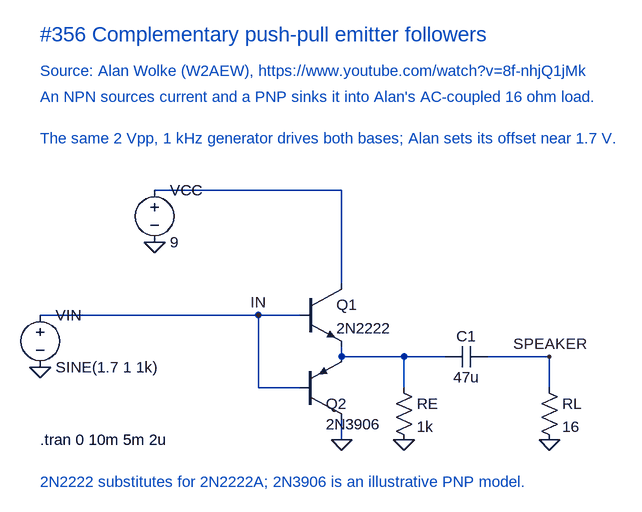
[diagram p0: schematic Complementary push-pull follower.asc]
Complementary push-pull follower.asc, the LTspice schematic file:
Version 4
SHEET 1 1312 800
WIRE 864 176 576 176
WIRE 864 320 864 176
WIRE 736 368 400 368
WIRE 800 368 736 368
WIRE 736 480 736 368
WIRE 800 480 736 480
WIRE 864 432 864 416
WIRE 1024 432 864 432
WIRE 960 480 960 432
WIRE 864 560 864 528
WIRE 1184 432 1088 432
WIRE 1184 480 1184 432
FLAG 576 256 0
FLAG 400 448 0
FLAG 864 560 0
FLAG 960 560 0
FLAG 1184 560 0
FLAG 736 368 IN
FLAG 1184 432 SPEAKER
SYMBOL voltage 576 160 R0
SYMATTR InstName VCC
SYMATTR Value 9
SYMBOL voltage 400 352 R0
SYMATTR InstName VIN
SYMATTR Value SINE(1.7 1 1k)
SYMBOL npn 800 320 R0
SYMATTR InstName Q1
SYMATTR Value 2N2222
SYMBOL pnp 800 528 M180
WINDOW 0 40 24 Left 2
WINDOW 3 40 -8 Left 2
SYMATTR InstName Q2
SYMATTR Value 2N3906
SYMBOL res 944 464 R0
SYMATTR InstName RE
SYMATTR Value 1k
SYMBOL cap 1088 416 R90
WINDOW 0 0 32 VBottom 2
WINDOW 3 32 32 VTop 2
SYMATTR InstName C1
SYMATTR Value 47u
SYMBOL res 1168 464 R0
SYMATTR InstName RL
SYMATTR Value 16
TEXT 400 -64 Left 3 ;#356 Complementary push-pull emitter followers
TEXT 400 -8 Left 2 ;Source: Alan Wolke (W2AEW), https://www.youtube.com/watch?v=8f-nhjQ1jMk
TEXT 400 32 Left 2 ;An NPN sources current and a PNP sinks it into Alan's AC-coupled 16 ohm load.
TEXT 400 96 Left 2 ;The same 2 Vpp, 1 kHz generator drives both bases; Alan sets its offset near 1.7 V.
TEXT 400 624 Left 2 ;2N2222 substitutes for 2N2222A; 2N3906 is an illustrative PNP model.
TEXT 400 560 Left 2 !.tran 0 10m 5m 2u

The netlist it stands for:
* Complementary push-pull follower.asc
VCC N001 0 9
VIN IN 0 SINE(1.7 1 1k)
Q1 N001 IN N002 0 2N2222
Q2 0 IN N002 0 2N3906
RE N002 0 1k
C1 SPEAKER N002 47u
RL SPEAKER 0 16
.model NPN NPN
.model PNP PNP
.lib standard.bjt
* #356 Complementary push-pull emitter followers
* Source: Alan Wolke (W2AEW), https://www.youtube.com/watch?v=8f-nhjQ1jMk
* An NPN sources current and a PNP sinks it into Alan's AC-coupled 16 ohm load.
* The same 2 Vpp, 1 kHz generator drives both bases; Alan sets its offset near 1.7 V.
* 2N2222 substitutes for 2N2222A; 2N3906 is an illustrative PNP model.
.tran 0 10m 5m 2u
.backanno
.end